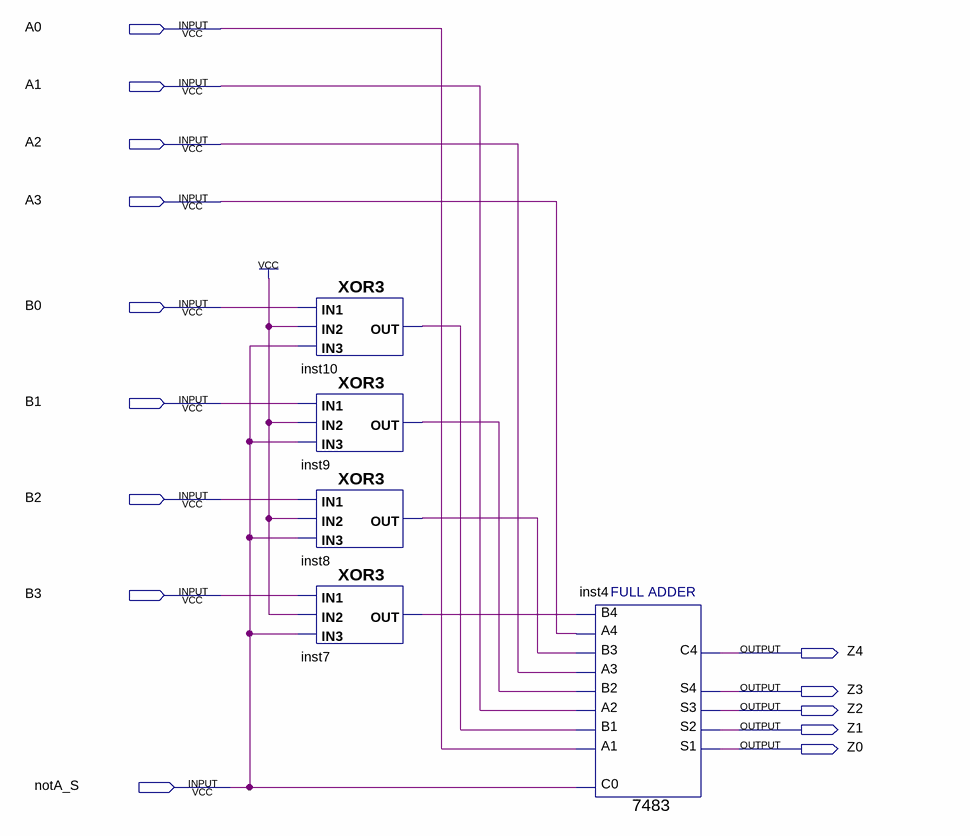
[diagram p0: schematic sheet]
// Quartus schematic Add-Sub.bdf as structural Verilog: 5 symbols, 14 pins
module \Add-Sub  (
  input  A0,
  input  A1,
  input  A2,
  input  A3,
  input  B0,
  input  B1,
  input  B2,
  input  B3,
  input  notA_S,
  output Z4,
  output Z3,
  output Z2,
  output Z1,
  output Z0
);

  wire inst7_out, inst8_out, inst9_out, inst10_out;

  XOR3 inst10 (.IN3(notA_S), .IN1(B0), .IN2(1'b1), .OUT(inst10_out));
  XOR3 inst9 (.IN3(notA_S), .IN1(B1), .IN2(1'b1), .OUT(inst9_out));
  XOR3 inst8 (.IN3(notA_S), .IN1(B2), .IN2(1'b1), .OUT(inst8_out));
  XOR3 inst7 (.IN3(notA_S), .IN1(B3), .IN2(1'b1), .OUT(inst7_out));
  \7483  inst4 (
    .B4(inst7_out), .C0(notA_S), .A1(A0), .A2(A1), .B1(inst10_out), .B2(inst9_out), .A3(A2), .B3(inst8_out),
    .A4(A3), .S3(Z2), .S4(Z3), .S2(Z1), .C4(Z4), .S1(Z0));
endmodule
